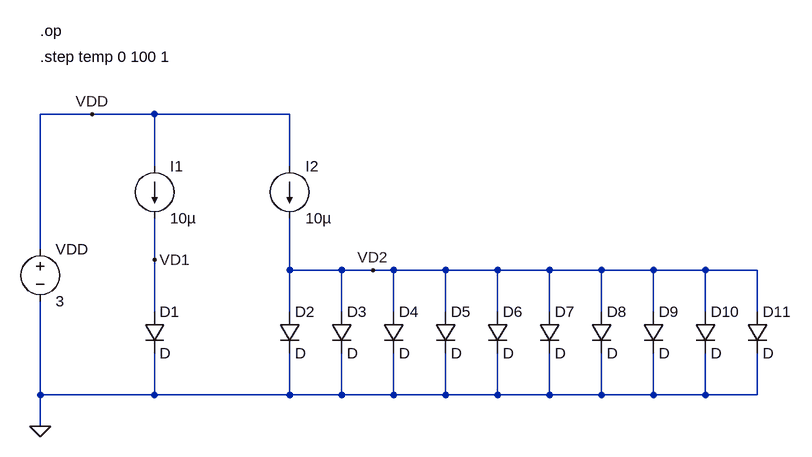
[diagram p0: schematic 4_bandgap.asc]
4_bandgap.asc, the LTspice schematic file:
Version 4
SHEET 1 1092 692
WIRE -1120 64 -1200 64
WIRE -1024 64 -1120 64
WIRE -816 64 -1024 64
WIRE -1024 144 -1024 64
WIRE -816 144 -816 64
WIRE -1200 272 -1200 64
WIRE -1024 288 -1024 224
WIRE -816 304 -816 224
WIRE -736 304 -816 304
WIRE -688 304 -736 304
WIRE -656 304 -688 304
WIRE -576 304 -656 304
WIRE -496 304 -576 304
WIRE -416 304 -496 304
WIRE -336 304 -416 304
WIRE -256 304 -336 304
WIRE -176 304 -256 304
WIRE -96 304 -176 304
WIRE -1024 368 -1024 288
WIRE -816 368 -816 304
WIRE -736 368 -736 304
WIRE -656 368 -656 304
WIRE -576 368 -576 304
WIRE -496 368 -496 304
WIRE -416 368 -416 304
WIRE -336 368 -336 304
WIRE -256 368 -256 304
WIRE -176 368 -176 304
WIRE -96 368 -96 304
WIRE -1200 496 -1200 352
WIRE -1024 496 -1024 432
WIRE -1024 496 -1200 496
WIRE -816 496 -816 432
WIRE -816 496 -1024 496
WIRE -736 496 -736 432
WIRE -736 496 -816 496
WIRE -656 496 -656 432
WIRE -656 496 -736 496
WIRE -576 496 -576 432
WIRE -576 496 -656 496
WIRE -496 496 -496 432
WIRE -496 496 -576 496
WIRE -416 496 -416 432
WIRE -416 496 -496 496
WIRE -336 496 -336 432
WIRE -336 496 -416 496
WIRE -256 496 -256 432
WIRE -256 496 -336 496
WIRE -176 496 -176 432
WIRE -176 496 -256 496
WIRE -96 496 -96 432
WIRE -96 496 -176 496
WIRE -1200 544 -1200 496
FLAG -1200 544 0
FLAG -1120 64 VDD
FLAG -1024 288 VD1
FLAG -688 304 VD2
SYMBOL voltage -1200 256 R0
WINDOW 123 0 0 Left 2
WINDOW 39 0 0 Left 2
SYMATTR InstName VDD
SYMATTR Value 3
SYMBOL diode -1040 368 R0
SYMATTR InstName D1
SYMBOL current -1024 144 R0
SYMATTR InstName I1
SYMATTR Value 10µ
SYMBOL diode -832 368 R0
SYMATTR InstName D2
SYMBOL current -816 144 R0
SYMATTR InstName I2
SYMATTR Value 10µ
SYMBOL diode -752 368 R0
SYMATTR InstName D3
SYMBOL diode -672 368 R0
SYMATTR InstName D4
SYMBOL diode -592 368 R0
SYMATTR InstName D5
SYMBOL diode -512 368 R0
SYMATTR InstName D6
SYMBOL diode -432 368 R0
SYMATTR InstName D7
SYMBOL diode -352 368 R0
SYMATTR InstName D8
SYMBOL diode -272 368 R0
SYMATTR InstName D9
SYMBOL diode -192 368 R0
SYMATTR InstName D10
SYMBOL diode -112 368 R0
SYMATTR InstName D11
TEXT -1200 -64 Left 2 !.op
TEXT -1200 -24 Left 2 !.step temp 0 100 1

The netlist it stands for:
* 4_bandgap.asc
VDD VDD 0 3
D1 VD1 0 D
I1 VDD VD1 10µ
D2 VD2 0 D
I2 VDD VD2 10µ
D3 VD2 0 D
D4 VD2 0 D
D5 VD2 0 D
D6 VD2 0 D
D7 VD2 0 D
D8 VD2 0 D
D9 VD2 0 D
D10 VD2 0 D
D11 VD2 0 D
.model D D
.lib standard.dio
.op
.step temp 0 100 1
.backanno
.end